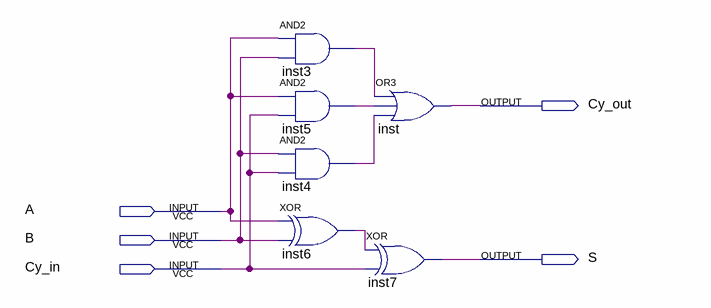
[diagram p0: schematic sheet]
// Quartus schematic full-adder.bdf as structural Verilog: 6 symbols, 5 pins
module \full-adder  (
  input  A,
  input  B,
  input  Cy_in,
  output Cy_out,
  output S
);

  wire inst3_out, inst4_out, inst5_out, inst6_out;

  and inst3 (inst3_out, A, B);
  and inst5 (inst5_out, A, Cy_in);
  and inst4 (inst4_out, B, Cy_in);
  xor inst6 (inst6_out, A, B);
  or inst (Cy_out, inst3_out, inst5_out, inst4_out);
  xor inst7 (S, inst6_out, Cy_in);
endmodule
